# Altium schematic sheet DDR4.SchDoc
size A3; SheetNumber: 8; SheetTotal: 9
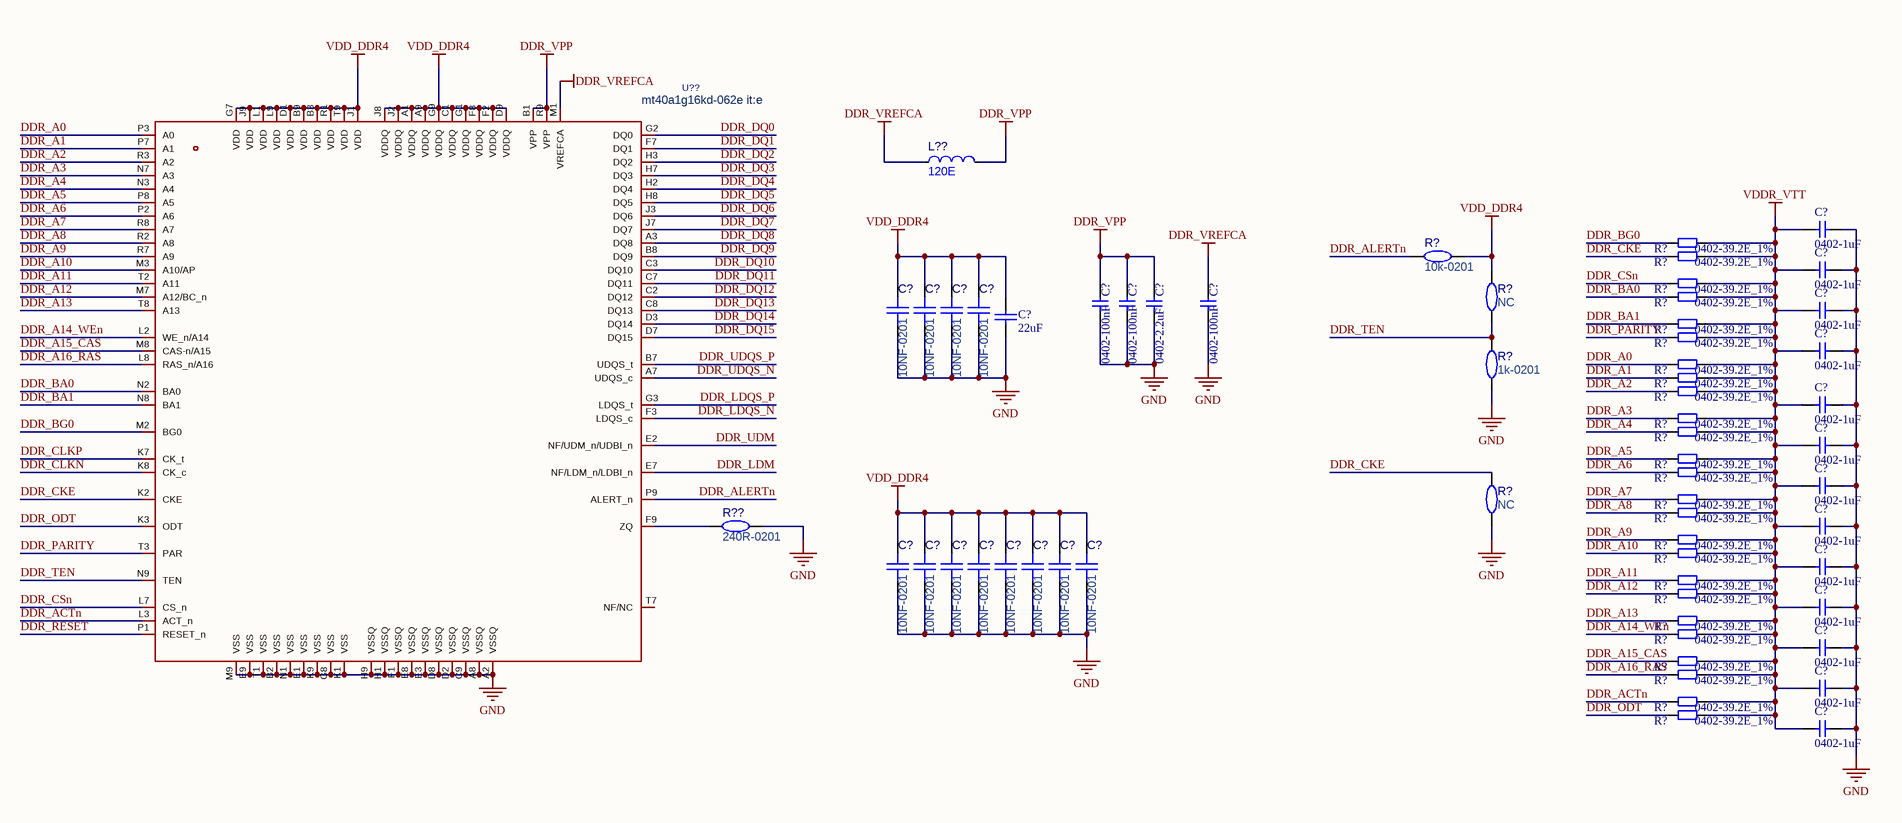
[diagram p0: DDR4.SchDoc]

## Parts
(Parts that share a designator on the sheet are numbered #1, #2 ... from top to bottom, then left to right.)
C?#1  0402-1uF  [C0402]
C?#2  0402-1uF  [C0402]
C?#3  0402-100nF  [C0402]
C?#4  0402-100nF  [C0402]
C?#5  0402-2.2uF  [C0402]
C?#6  0402-100nF  [C0402]
C?#7  10NF-0201  [C0201]
C?#8  10NF-0201  [C0201]
C?#9  10NF-0201  [C0201]
C?#10  10NF-0201  [C0201]
C?#11  0402-1uF  [C0402]
C?#12  22uF  [C0805]
C?#13  0402-1uF  [C0402]
C?#14  0402-1uF  [C0402]
C?#15  0402-1uF  [C0402]
C?#16  0402-1uF  [C0402]
C?#17  0402-1uF  [C0402]
C?#18  10NF-0201  [C0201]
C?#19  10NF-0201  [C0201]
C?#20  10NF-0201  [C0201]
C?#21  10NF-0201  [C0201]
C?#22  10NF-0201  [C0201]
C?#23  10NF-0201  [C0201]
C?#24  10NF-0201  [C0201]
C?#25  10NF-0201  [C0201]
C?#26  0402-1uF  [C0402]
C?#27  0402-1uF  [C0402]
C?#28  0402-1uF  [C0402]
C?#29  0402-1uF  [C0402]
C?#30  0402-1uF  [C0402]
L??  120E  [L0603]
R?#1  0402-39.2E_1%  [R0402]
R?#2  10k-0201  [R0201]
R?#3  0402-39.2E_1%  [R0402]
R?#4  0402-39.2E_1%  [R0402]
R?#5  NC  [R0201]
R?#6  0402-39.2E_1%  [R0402]
R?#7  0402-39.2E_1%  [R0402]
R?#8  0402-39.2E_1%  [R0402]
R?#9  1k-0201  [R0201]
R?#10  0402-39.2E_1%  [R0402]
R?#11  0402-39.2E_1%  [R0402]
R?#12  0402-39.2E_1%  [R0402]
R?#13  0402-39.2E_1%  [R0402]
R?#14  0402-39.2E_1%  [R0402]
R?#15  0402-39.2E_1%  [R0402]
R?#16  0402-39.2E_1%  [R0402]
R?#17  NC  [R0201]
R?#18  0402-39.2E_1%  [R0402]
R?#19  0402-39.2E_1%  [R0402]
R?#20  0402-39.2E_1%  [R0402]
R?#21  0402-39.2E_1%  [R0402]
R?#22  0402-39.2E_1%  [R0402]
R?#23  0402-39.2E_1%  [R0402]
R?#24  0402-39.2E_1%  [R0402]
R?#25  0402-39.2E_1%  [R0402]
R?#26  0402-39.2E_1%  [R0402]
R?#27  0402-39.2E_1%  [R0402]
R?#28  0402-39.2E_1%  [R0402]
R?#29  0402-39.2E_1%  [R0402]
R??  240R-0201  [R0201]
U??  mt40a1g16kd-062e it:e  [FBGA-96_L13.0-W9.0-R16-C6-P0.80-TL]

## Nets
DDR_VPP: C?#3.1 C?#4.1 C?#5.1 L??.2 U??.B1(VPP) U??.R9(VPP)
DDR_VREFCA: C?#6.1 L??.1 U??.M1(VREFCA)
GND: C?#1.2 C?#2.2 C?#3.2 C?#4.2 C?#5.2 C?#6.2 C?#7.1 C?#8.1 C?#9.1 C?#10.1 C?#11.2 C?#12.1 C?#13.2 C?#14.2 C?#15.2 C?#16.2 C?#17.2 C?#18.1 C?#19.1 C?#20.1 C?#21.1 C?#22.1 C?#23.1 C?#24.1 C?#25.1 C?#26.2 C?#27.2 C?#28.2 C?#29.2 C?#30.2 R?#9.1 R?#17.1 R??.2 U??.A2(VSSQ) U??.A8(VSSQ) U??.B2(VSS) U??.C9(VSSQ) U??.D2(VSSQ) U??.D8(VSSQ) U??.E1(VSS) U??.E3(VSSQ) U??.E8(VSSQ) U??.E9(VSS) U??.F1(VSSQ) U??.G8(VSS) U??.H1(VSSQ) U??.H9(VSSQ) U??.K1(VSS) U??.K9(VSS) U??.M9(VSS) U??.N1(VSS) U??.T1(VSS)
VDD_DDR4: C?#7.2 C?#8.2 C?#9.2 C?#10.2 C?#12.2 C?#18.2 C?#19.2 C?#20.2 C?#21.2 C?#22.2 C?#23.2 C?#24.2 C?#25.2 R?#2.2 R?#5.2 U??.A1(VDDQ) U??.A9(VDDQ) U??.B3(VDD) U??.B9(VDD) U??.C1(VDDQ) U??.D1(VDD) U??.D9(VDDQ) U??.F2(VDDQ) U??.F8(VDDQ) U??.G1(VDDQ) U??.G7(VDD) U??.G9(VDDQ) U??.J1(VDD) U??.J2(VDDQ) U??.J8(VDDQ) U??.J9(VDD) U??.L1(VDD) U??.L9(VDD) U??.R1(VDD) U??.T9(VDD)
VDDR_VTT: C?#1.1 C?#2.1 C?#11.1 C?#13.1 C?#14.1 C?#15.1 C?#16.1 C?#17.1 C?#26.1 C?#27.1 C?#28.1 C?#29.1 C?#30.1 R?#1.2 R?#3.2 R?#4.2 R?#6.2 R?#7.2 R?#8.2 R?#10.2 R?#11.2 R?#12.2 R?#13.2 R?#14.2 R?#15.2 R?#16.2 R?#18.2 R?#19.2 R?#20.2 R?#21.2 R?#22.2 R?#23.2 R?#24.2 R?#25.2 R?#26.2 R?#27.2 R?#28.2 R?#29.2
DDR_A0: R?#10.1 U??.P3(A0)
DDR_A1: R?#11.1 U??.P7(A1)
DDR_A2: R?#12.1 U??.R3(A2)
DDR_A3: R?#13.1 U??.N7(A3)
DDR_A4: R?#14.1 U??.N3(A4)
DDR_A5: R?#15.1 U??.P8(A5)
DDR_A6: R?#16.1 U??.P2(A6)
DDR_A7: R?#18.1 U??.R8(A7)
DDR_A8: R?#19.1 U??.R2(A8)
DDR_A9: R?#20.1 U??.R7(A9)
DDR_A10: R?#21.1 U??.M3(A10/AP)
DDR_A11: R?#22.1 U??.T2(A11)
DDR_A12: R?#23.1 U??.M7(A12/BC_n)
DDR_A13: R?#24.1 U??.T8(A13)
DDR_A14_WEn: R?#25.1 U??.L2(WE_n/A14)
DDR_A15_CAS: R?#26.1 U??.M8(CAS-n/A15)
DDR_A16_RAS: R?#27.1 U??.L8(RAS_n/A16)
DDR_ACTn: R?#28.1 U??.L3(ACT_n)
DDR_ALERTn: R?#2.1 U??.P9(ALERT_n)
DDR_BA0: R?#6.1 U??.N2(BA0)
DDR_BA1: R?#7.1 U??.N8(BA1)
DDR_BG0: R?#1.1 U??.M2(BG0)
DDR_CKE: R?#3.1 R?#17.2 U??.K2(CKE)
DDR_CLKN: U??.K8(CK_c)
DDR_CLKP: U??.K7(CK_t)
DDR_CSn: R?#4.1 U??.L7(CS_n)
DDR_DQ0: U??.G2(DQ0)
DDR_DQ1: U??.F7(DQ1)
DDR_DQ2: U??.H3(DQ2)
DDR_DQ3: U??.H7(DQ3)
DDR_DQ4: U??.H2(DQ4)
DDR_DQ5: U??.H8(DQ5)
DDR_DQ6: U??.J3(DQ6)
DDR_DQ7: U??.J7(DQ7)
DDR_DQ8: U??.A3(DQ8)
DDR_DQ9: U??.B8(DQ9)
DDR_DQ10: U??.C3(DQ10)
DDR_DQ11: U??.C7(DQ11)
DDR_DQ12: U??.C2(DQ12)
DDR_DQ13: U??.C8(DQ13)
DDR_DQ14: U??.D3(DQ14)
DDR_DQ15: U??.D7(DQ15)
DDR_LDM: U??.E7(NF/LDM_n/LDBI_n)
DDR_LDQS_N: U??.F3(LDQS_c)
DDR_LDQS_P: U??.G3(LDQS_t)
DDR_ODT: R?#29.1 U??.K3(ODT)
DDR_PARITY: R?#8.1 U??.T3(PAR)
DDR_RESET: U??.P1(RESET_n)
DDR_TEN: R?#5.1 R?#9.2 U??.N9(TEN)
DDR_UDM: U??.E2(NF/UDM_n/UDBI_n)
DDR_UDQS_N: U??.A7(UDQS_c)
DDR_UDQS_P: U??.B7(UDQS_t)
NetR??_1: R??.1 U??.F9(ZQ)

Not connected (* = marked no-connect by the designer): U?? T7(NF/NC)

## Library data of the parts
C?#1-C?#6 C?#11 C?#13-C?#17 C?#26-C?#30 = C0402: 物料号: *; 物料描述: *
C?#7-C?#10 C?#18-C?#25 = 0201-C: 容值:1uF;精度:±20%;额定电压:6.3V;温度系数:X5R;; Manufacturer: muRata(村田); Symbol: GRM033R60J105MEA2D; AddInBom: yes; ModelId: e8033a7cb35143ffb28e3b81b2577ea0; ModelName: C0201_L0.6-W0.3-H0.3; ModelTransform: 23.622,11.811,0,0,0,0,0,0,0; Value: 1uF; Tolerance: ±20%; Voltage Rating: 6.3V; Temperature Coefficient: X5R; LCSC Part Name: 1uF ±20% 6.3V; SupplierPart: C76930; ManufacturerPart: GRM033R60J105MEA2D; Supplier Footprint: 0201; JLCPCB Part Class: Extended Part; Datasheet: https://item.szlcsc.com/datasheet/GRM033R60J105MEA2D/78057.html; Supplier: LCSC; ConvertToPcb: yes; FootprintName: C0201
C?#12 = C0805: Capacitor; Value: 104; Published: 8-Jun-2000; LatestRevisionDate: 17-Jul-2002; LatestRevisionNote: Re-released for DXP Platform.; Publisher: Altium Limited
L?? = L0603: 电感值:10uH;精度:±10%;额定电流:3mA;饱和电流(Isat):-;直流电阻(DCR):1.85Ω;; Manufacturer: Sunlord(顺络); Symbol: SDFL1608S100KTF; AddInBom: yes; ModelId: 2bc5ec593d464d6ba9807aec0b5673c2; ModelName: L0603_L1.6-W0.8-H0.5_BEAD; ModelTransform: 62.992,31.496,0,180,0,0,0.094,0.629,0; Value: 10uH; Tolerance: ±10%; Current Rating: 3mA; DC Resistance(DCR): 1.85Ω; Q @ Frequency: 30@2MHz; Frequency - Self Resonant: 17MHz; LCSC Part Name: 10uH ±10%; SupplierPart: C1035; ManufacturerPart: SDFL1608S100KTF; Supplier Footprint: 0603; JLCPCB Part Class: Basic Part; Datasheet: https://item.szlcsc.com/datasheet/SDFL1608S100KTF/1387.html; Supplier: LCSC; ConvertToPcb: yes; FootprintName: L0603; Current - Saturation (Isat): -; Ratings: -
R?#1 R?#3 R?#4 R?#6-R?#8 R?#10-R?#16 R?#18-R?#29 = R0402: 片式电阻; 物料描述: 片式电阻器-0805-10KΩ-5%-JT; 物料号: NA
R?#2 R?#5 R?#9 R?#17 R?? = 0210-R: 电阻类型:厚膜电阻;阻值:10kΩ;精度:±1%;功率:50mW;工作电压:25V;温度系数:±200ppm/℃;; Manufacturer: YAGEO(国巨); Symbol: RC0201FR-0710KL; AddInBom: yes; ModelId: 0e006ba4c37b4b73b0e85d5d1c6800cb; ModelName: R0201_L0.6-W0.3-H0.3; ModelTransform: 23.622,11.811,0,0,0,0,0,-0.0005,0; Value: 10kΩ; Tolerance: ±1%; Power(Watts): 50mW; Voltage-Supply(Max): 25V; LCSC Part Name: 厚膜电阻 10kΩ ±1% 50mW; SupplierPart: C106225; ManufacturerPart: RC0201FR-0710KL; Supplier Footprint: 0201; JLCPCB Part Class: Extended Part; Datasheet: https://item.szlcsc.com/datasheet/RC0201FR-0710KL/107440.html; Supplier: LCSC; ConvertToPcb: yes; FootprintName: R0201; Type: 厚膜电阻; Temperature Coefficient: ±200ppm/℃; Operating Temperature: -55℃~+125℃
U?? = mt40a1g16kd-062e it:e: 特性：VDD = VDDQ = 1.2V ± 60mV。VPP = 2.5V-125mV + 250mV。On-die, internal, adjustable VREFDQ generation。1.2V pseudo open-drain I/O。TC maximum up to 95°C。64ms, 8192-cycle refresh up to 85°C; Manufacturer: micron(镁光); AddInBom: yes; ModelId: 84b52cecb1cd4cbe82c7ffb61f530f61; ModelTransform: 354.33,511.81,0,0,0,0,0,0,0; Symbol: MT40A1G16KD-062E IT:E; LCSC Part Name: 16Gb：X4、x8、X16 DDR4 SDRAM; SupplierPart: C5330483; ManufacturerPart: MT40A1G16KD-062E IT:E; Supplier Footprint: FBGA-96; JLCPCB Part Class: Extended Part; Datasheet: https://item.szlcsc.com/datasheet/MT40A1G16KD-062E%2520IT%253AE/6089440.html; Supplier: LCSC; ConvertToPcb: yes; FootprintName: FBGA-96_L13.0-W9.0-R16-C6-P0.80-TL; ModelName: FBGA-96_L13.0-W9.0-R16-C6-P0.80-TL